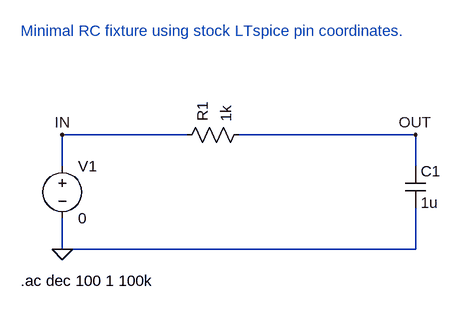
[diagram p0: schematic ltspice-rc.asc]
ltspice-rc.asc, the LTspice schematic file:
Version 4
SHEET 1 1120 720
WIRE 352 192 160 192
WIRE 704 192 432 192
WIRE 160 240 160 192
WIRE 704 240 704 192
WIRE 160 368 160 320
WIRE 704 368 704 304
WIRE 704 368 160 368
FLAG 160 192 IN
FLAG 704 192 OUT
FLAG 160 368 0
SYMBOL voltage 160 224 R0
WINDOW 0 24 16 Left 2
SYMATTR InstName V1
SYMATTR Value 0
SYMATTR Value2 AC 1
SYMBOL res 336 208 R270
SYMATTR InstName R1
SYMATTR Value 1k
SYMBOL cap 688 240 R0
SYMATTR InstName C1
SYMATTR Value 1u
TEXT 96 32 Left 2 ;Minimal RC fixture using stock LTspice pin coordinates.
TEXT 96 416 Left 2 !.ac dec 100 1 100k

The netlist it stands for:
* ltspice-rc.asc
V1 IN 0 0 AC 1
R1 IN OUT 1k
C1 OUT 0 1u
* Minimal RC fixture using stock LTspice pin coordinates.
.ac dec 100 1 100k
.backanno
.end